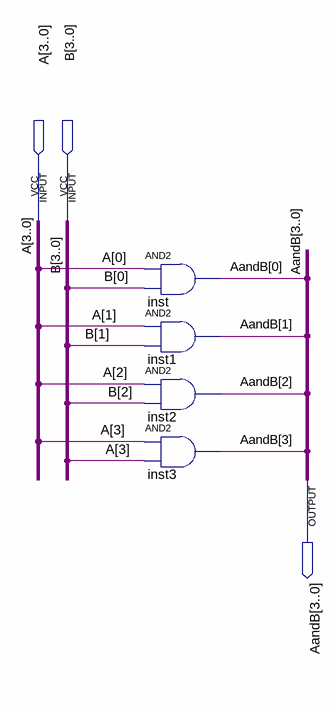
[diagram p0: schematic sheet]
// Quartus schematic AandB.bdf as structural Verilog: 4 symbols, 3 pins
module AandB (
  input  [3:0] A,
  input  [3:0] B,
  output [3:0] AandB
);

  and inst (AandB[0], A[0], B[0]);
  and inst1 (AandB[1], A[1], B[1]);
  and inst2 (AandB[2], A[2], B[2]);
  and inst3 (AandB[3], A[3], A[3]);
endmodule
